# Altium schematic sheet Schematic.SchDoc
size 431 x 279 mm; SheetNumber: 1; SheetTotal: 1; ENG_APP_DATE: --/--/--; DSN_APP_DATE: --/--/--; CHK_APP_DATE: --/--/--
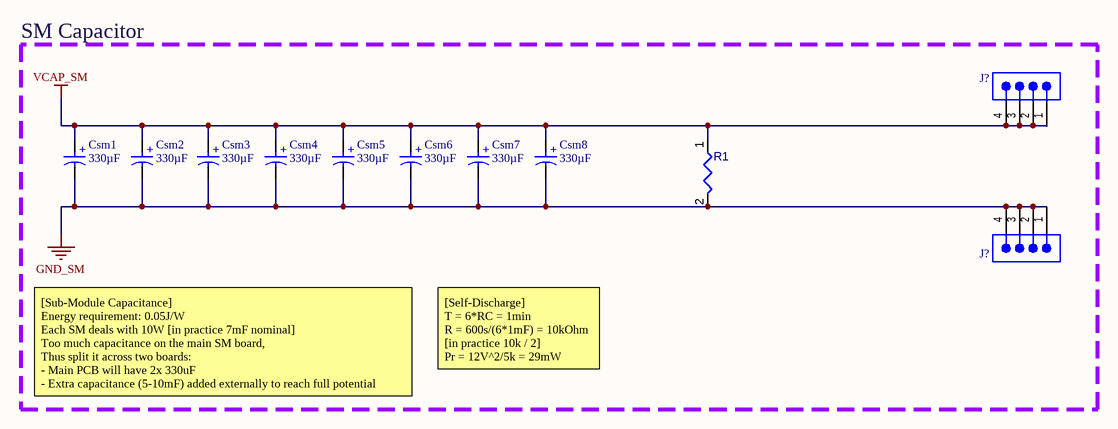
[diagram p0: Schematic.SchDoc]

## Parts
(Parts that share a designator on the sheet are numbered #1, #2 ... from top to bottom, then left to right.)
Csm1  Capacitance: 330µF  [WCAP-ATG8_D8H11.5]  (hidden comment: 860010474012)
Csm2  Capacitance: 330µF  [WCAP-ATG8_D8H11.5]  (hidden comment: 860010474012)
Csm3  Capacitance: 330µF  [WCAP-ATG8_D8H11.5]  (hidden comment: 860010474012)
Csm4  Capacitance: 330µF  [WCAP-ATG8_D8H11.5]  (hidden comment: 860010474012)
Csm5  Capacitance: 330µF  [WCAP-ATG8_D8H11.5]  (hidden comment: 860010474012)
Csm6  Capacitance: 330µF  [WCAP-ATG8_D8H11.5]  (hidden comment: 860010474012)
Csm7  Capacitance: 330µF  [WCAP-ATG8_D8H11.5]  (hidden comment: 860010474012)
Csm8  Capacitance: 330µF  [WCAP-ATG8_D8H11.5]  (hidden comment: 860010474012)
J?#1  TSW-104-08-L-S  [SMTC-TSW-104-08-X-S]  (value not drawn)  (no BOM)
J?#2  TSW-104-08-L-S  [SMTC-TSW-104-08-X-S]  (value not drawn)  (no BOM)
R1  R_TH  [Axial 300mil]  (value not drawn)

## Blocks framed on the sheet
SM Capacitor: Csm1-Csm8 J?#1 J?#2 R1

## Nets
GND_SM: Csm1.2(N) Csm2.2(N) Csm3.2(N) Csm4.2(N) Csm5.2(N) Csm6.2(N) Csm7.2(N) Csm8.2(N) J?#2.1 J?#2.2 J?#2.3 J?#2.4 R1.2
VCAP_SM: Csm1.1(P) Csm2.1(P) Csm3.1(P) Csm4.1(P) Csm5.1(P) Csm6.1(P) Csm7.1(P) Csm8.1(P) J?#1.1 J?#1.2 J?#1.3 J?#1.4 R1.1

## Notes on the sheet
- [Sub-Module Capacitance]
  Energy requirement: 0.05J/W
  Each SM deals with 10W [in practice 7mF nominal]
  Too much capacitance on the main SM board,
  Thus split it across two boards:
  - Main PCB will have 2x 330uF
  - Extra capacitance (5-10mF) added externally to reach full potential
- [Self-Discharge]
  T = 6*RC = 1min
  R = 600s/(6*1mF) = 10kOhm [in practice 10k / 2]
  Pr = 12V^2/5k = 29mW
- 8
- 7
- 6
- 5
- 4
- 3
- DWG. NO.
- REV.
- SHT.
- 2
- 1
- THIS DOCUMENT AND THE DATA DISCLOSED HEREIN OR HEREWITH IS THE PROPERTY OF ALTIUM LIMITED AND MAY BE FREELY DISTRIBUTED IN WHOLE. NO RIGHTS ARE RESERVED OR EXPRESS OR IMPLIED WARANTEE GIVEN.
- REVISION
- DESCRIPTION
- DATE
- APPROVED
- F
- E
- D
- C
- B
- ENG:
- APPROVALS
- PROJECT
- SUITE 200
- 2175 SALK AVENUE
- CARLSBAD, CA 92008
- A
- DSN:
- CHK:
- REFERENCE DOCUMENTS
- PROJECT REVISION:
- TITLE
- DOCUMENT REVISION:
- DESIGN ITEM:
- USA
- BOM:
- FAB DWG:
- PCB DWG:
- ASSY DWG:
- SCALE:
- SIZE
- CAGE CODE
- FILE NAME
- DWG NO.
- SHEET
- OF
- REV
- (in symbol CMP-03913-54007214-1) +

## Library data of the parts
Csm1-Csm8 = CMP-03913-54007214-1: 860010474012 WCAP-ATG8 Aluminum Electrolytic Capacitors; Manufacturer: Panasonic; Manufacturer Part Number: ECA-1CHG471; Pitch: 3.5mm; Life (Hours): 2000hours; Voltage Rating (DC): 25V; Polarity: Polar; Tolerance: 20%; Leakage Current: 82.5µA; Ripple Current: 451mA; Dielectric Material: Aluminium; Value: 470uF; Rated DC Voltage (URdc): 16V; Tan Delta: 0.2; Material: Aluminium; Diameter: 8mm; Min Operating Temperature: -40°C; Voltage Rating: 25V; NexarPartId: 54007214; Lead Pitch: 3.5052mm; Height - Seated (Max): 13.0048mm; Max Operating Temperature: 85°C; Length: 11.5mm; RoHS: Compliant; Mount: Through Hole; Height: 11.5mm; Packaging: Tape & Box (TB); REACH SVHC: Unknown; Case/Package: Radial; Supplier 1: Mouser; Supplier Part Number 1: 667-ECA-1CHG471; Category: Aluminum Electrolytic Capacitors; Stock 1: 3498; Pricing 1: 1=0.23, 10=0.168, 50=0.168, 100=0.132, 1000=0.127, 10000=0.114 (USD); Mounting Technology: Through Hole; Pins: 2; Package Shape: Cylindrical; Terminal Finish: Tin; JESD-609 Code: e3; Capacitor Type: Aluminium; Tolerance  (fill in as +-): 20%; Package Style: RadialMeter; Tolerance (fill in as +-): 20%; Termination: Wire; Terminal Pitch: 3.5mm; Reach SVHC Compliant: Yes; RoHS Compliant: Yes; ComponentLink1URL: https://datasheet.ciiva.com:443/pdfs/VipMasterIC/IC/PANA/PANA-S-A0009903858/PANA-S-A0009903858-1.pdf?src-supplier=IHS+Markit; ComponentLink1Description: https://datasheet.ciiva.com:443/pdfs/VipMasterIC/IC/PANA/PANA-S-A0009903858/PANA-S-A0009903858-1.pdf?src-supplier=IHS+Markit; ComponentLink2URL: https://datasheet.ciiva.com/11777/0900766b800301b8-11777772.pdf?src-supplier=Rs; ComponentLink2Description: https://datasheet.ciiva.com/11777/0900766b800301b8-11777772.pdf?src-supplier=Rs; ComponentLink3URL: https://datasheet.ciiva.com/16397/aba0000ce26-16397142.pdf?src-supplier=Future+Electronics; ComponentLink3Description: https://datasheet.ciiva.com/16397/aba0000ce26-16397142.pdf?src-supplier=Future+Electronics; ComponentLink4URL: https://datasheet.ciiva.com/2984/aba0000ce26-2984287.pdf?src-supplier=Avnet; ComponentLink4Description: https://datasheet.ciiva.com/2984/aba0000ce26-2984287.pdf?src-supplier=Avnet; ComponentLink5URL: https://datasheet.ciiva.com/15197/getdatasheetpartid-255238-15197877.pdf?src-supplier=Verical; ComponentLink5Description: https://datasheet.ciiva.com/15197/getdatasheetpartid-255238-15197877.pdf?src-supplier=Verical; ComponentLink6URL: https://datasheet.ciiva.com/46386/1903322-46386215.pdf?src-supplier=Element14; ComponentLink6Description: https://datasheet.ciiva.com/46386/1903322-46386215.pdf?src-supplier=Element14; ComponentLink7URL: https://datasheet.ciiva.com/30106/8aba0000ce26-30106396.pdf?src-supplier=Onlinecomponents.com; ComponentLink7Description: https://datasheet.ciiva.com/30106/8aba0000ce26-30106396.pdf?src-supplier=Onlinecomponents.com
J?#1 J?#2 = CMP-1024-00358-1: 0.025" SQ Post Header, Through-hole, Vertical, -55 to 125 degC, 2.54 mm Pitch, 4-Pin, Male, RoHS; Manufacturer: Samtec; Manufacturer Part Number: G800W304018EU; Pitch: 2.54 mm; Connector Type: BOARD CONNECTOR; Option: General Purpose; Filter Feature: No; Number of Rows Loaded: 1; Number of Contacts: 4; PartNumber: TSW-104-08-L-S; RoHS: True; Temperature Range: -55 to 125 degC; PackageDescription: .025[0.64] SQ. Post Terminal Strip Assembly; Orientation: Vertical; ComponentLink2URL: http://www.samtec.com/documents/webfiles/pdf/TSW_TH.PDF; ComponentLink1Description: Manufacturer URL; ComponentLink2Description: Datasheet; PackageVersion: DM, 8/1988; ComponentLink3URL: http://www.samtec.com/documents/webfiles/cpdf/TSW-XXX-XX-XXX-X-XX-XXX-MKT.pdf; Mounting Technology: Through-hole; PackageReference: TSW-104-08-X-S; ComponentLink3Description: Package Specification; ComponentLink1URL: http://www.samtec.com; DatasheetVersion: F-214; Supplier 1: Farnell; Supplier Part Number 1: 3882398; Category: Connectors; Stock 1: 3007; Pricing 1: 100=0.039, 1000=0.034, 2500=0.033, 5000=0.032, 10000=0.03, 20000=0.028 (GBP); Contact Material: Brass; Contact Finish - Mating: GOLD OVER NICKEL (50); Contact Finish - Termination: Tin (Sn) - with Nickel (Ni) barrier; JESD-609 Code: e3; Contact Gender: Male; Mixed Contacts: No; Mounting Style: STRAIGHT; Termination: Solder; Terminal Pitch: 2.54mm; Flammability Rating: UL94 V-0; DIN Conformance: No; IEC Conformance: No; MIL Conformance: No; RoHS Compliant: Yes
R1 = CMP-009-00508-2: Through hole resistor 1/4W